# Altium schematic sheet Top_Sheet.SchDoc
size A4; SheetNumber: 1; SheetTotal: 5
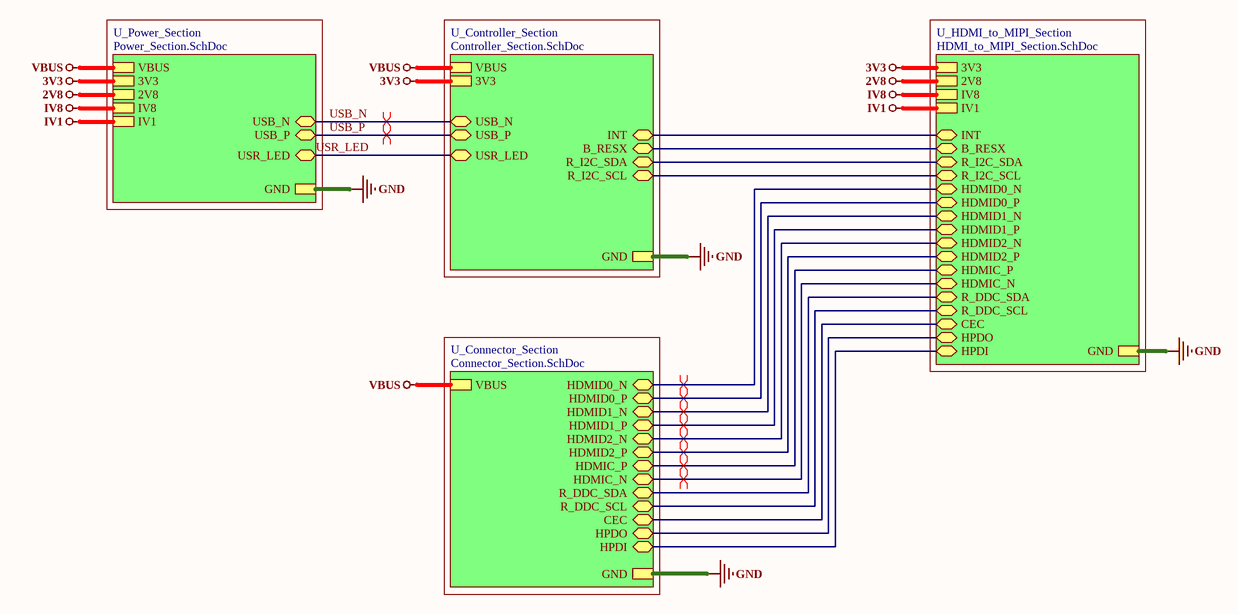
[diagram p0: Top_Sheet.SchDoc]

## Sub-sheets
U_Connector_Section = Connector_Section.SchDoc: HDMID0_N (bidir), HDMID0_P (bidir), HDMID1_N (bidir), HDMID1_P (bidir), HDMID2_N (bidir), HDMID2_P (bidir), HDMIC_P (bidir), HDMIC_N (bidir), R_DDC_SDA (bidir), R_DDC_SCL (bidir), CEC (bidir), HPDO (bidir), HPDI (bidir), VBUS, GND
U_Controller_Section = Controller_Section.SchDoc: USB_N (bidir), USB_P (bidir), USR_LED (bidir), INT (bidir), B_RESX (bidir), R_I2C_SDA (bidir), R_I2C_SCL (bidir), 3V3, VBUS, GND
U_HDMI_to_MIPI_Section = HDMI_to_MIPI_Section.SchDoc: 3V3, GND, IV8, IV1, 2V8, INT (bidir), B_RESX (bidir), R_I2C_SDA (bidir), R_I2C_SCL (bidir), HDMID0_N (bidir), HDMID0_P (bidir), HDMID1_N (bidir), HDMID1_P (bidir), HDMID2_N (bidir), HDMID2_P (bidir), HDMIC_P (bidir), HDMIC_N (bidir), R_DDC_SDA (bidir), R_DDC_SCL (bidir), CEC (bidir), HPDO (bidir), HPDI (bidir)
U_Power_Section = Power_Section.SchDoc: 3V3, GND, VBUS, IV8, IV1, 2V8, USB_N (bidir), USB_P (bidir), USR_LED (bidir)

## Nets
2V8: sheet U_Power_Section/2V8, sheet U_HDMI_to_MIPI_Section/2V8
3V3: sheet U_Power_Section/3V3, sheet U_Controller_Section/3V3, sheet U_HDMI_to_MIPI_Section/3V3
GND: sheet U_Power_Section/GND, sheet U_Connector_Section/GND, sheet U_Controller_Section/GND, sheet U_HDMI_to_MIPI_Section/GND
IV1: sheet U_Power_Section/IV1, sheet U_HDMI_to_MIPI_Section/IV1
IV8: sheet U_Power_Section/IV8, sheet U_HDMI_to_MIPI_Section/IV8
VBUS: sheet U_Power_Section/VBUS, sheet U_Connector_Section/VBUS, sheet U_Controller_Section/VBUS
USB_N: sheet U_Power_Section/USB_N, sheet U_Controller_Section/USB_N
USB_P: sheet U_Power_Section/USB_P, sheet U_Controller_Section/USB_P
USR_LED: sheet U_Power_Section/USR_LED, sheet U_Controller_Section/USR_LED
(unnamed): sheet U_Connector_Section/HDMID0_N, sheet U_HDMI_to_MIPI_Section/HDMID0_N
(unnamed): sheet U_Connector_Section/HDMID0_P, sheet U_HDMI_to_MIPI_Section/HDMID0_P
(unnamed): sheet U_Connector_Section/HDMID1_N, sheet U_HDMI_to_MIPI_Section/HDMID1_N
(unnamed): sheet U_Connector_Section/HDMID1_P, sheet U_HDMI_to_MIPI_Section/HDMID1_P
(unnamed): sheet U_Connector_Section/HDMID2_N, sheet U_HDMI_to_MIPI_Section/HDMID2_N
(unnamed): sheet U_Connector_Section/HDMID2_P, sheet U_HDMI_to_MIPI_Section/HDMID2_P
(unnamed): sheet U_Connector_Section/HDMIC_P, sheet U_HDMI_to_MIPI_Section/HDMIC_P
(unnamed): sheet U_Connector_Section/HDMIC_N, sheet U_HDMI_to_MIPI_Section/HDMIC_N
(unnamed): sheet U_Connector_Section/R_DDC_SDA, sheet U_HDMI_to_MIPI_Section/R_DDC_SDA
(unnamed): sheet U_Connector_Section/R_DDC_SCL, sheet U_HDMI_to_MIPI_Section/R_DDC_SCL
(unnamed): sheet U_Connector_Section/CEC, sheet U_HDMI_to_MIPI_Section/CEC
(unnamed): sheet U_Connector_Section/HPDO, sheet U_HDMI_to_MIPI_Section/HPDO
(unnamed): sheet U_Connector_Section/HPDI, sheet U_HDMI_to_MIPI_Section/HPDI
(unnamed): sheet U_Controller_Section/INT, sheet U_HDMI_to_MIPI_Section/INT
(unnamed): sheet U_Controller_Section/B_RESX, sheet U_HDMI_to_MIPI_Section/B_RESX
(unnamed): sheet U_Controller_Section/R_I2C_SDA, sheet U_HDMI_to_MIPI_Section/R_I2C_SDA
(unnamed): sheet U_Controller_Section/R_I2C_SCL, sheet U_HDMI_to_MIPI_Section/R_I2C_SCL

## Layout directives
differential pair; net class USB; differential pair class USB_Lines; rule Impedance Constraint [Min = 85.00    Max = 90.00    ]; rule Matched Net Lengths [Tolerance = 50mil]: USB_N, USB_P
differential pair; net class HDMI; differential pair class HDMI_Lines; rule Impedance Constraint [Min = 95.00    Max = 100.0    ]; rule Matched Net Lengths [Tolerance = 5mil]: (no net found under the mark)

## Notes on the sheet
- File:
- Title:
- Date:
- Page
- Num:
- Total:
- Drawn By: Huzaifa Ali